# Altium schematic sheet Radar_Sheet2.SchDoc
size 420 x 297 mm; SheetNumber: 5; SheetTotal: 6
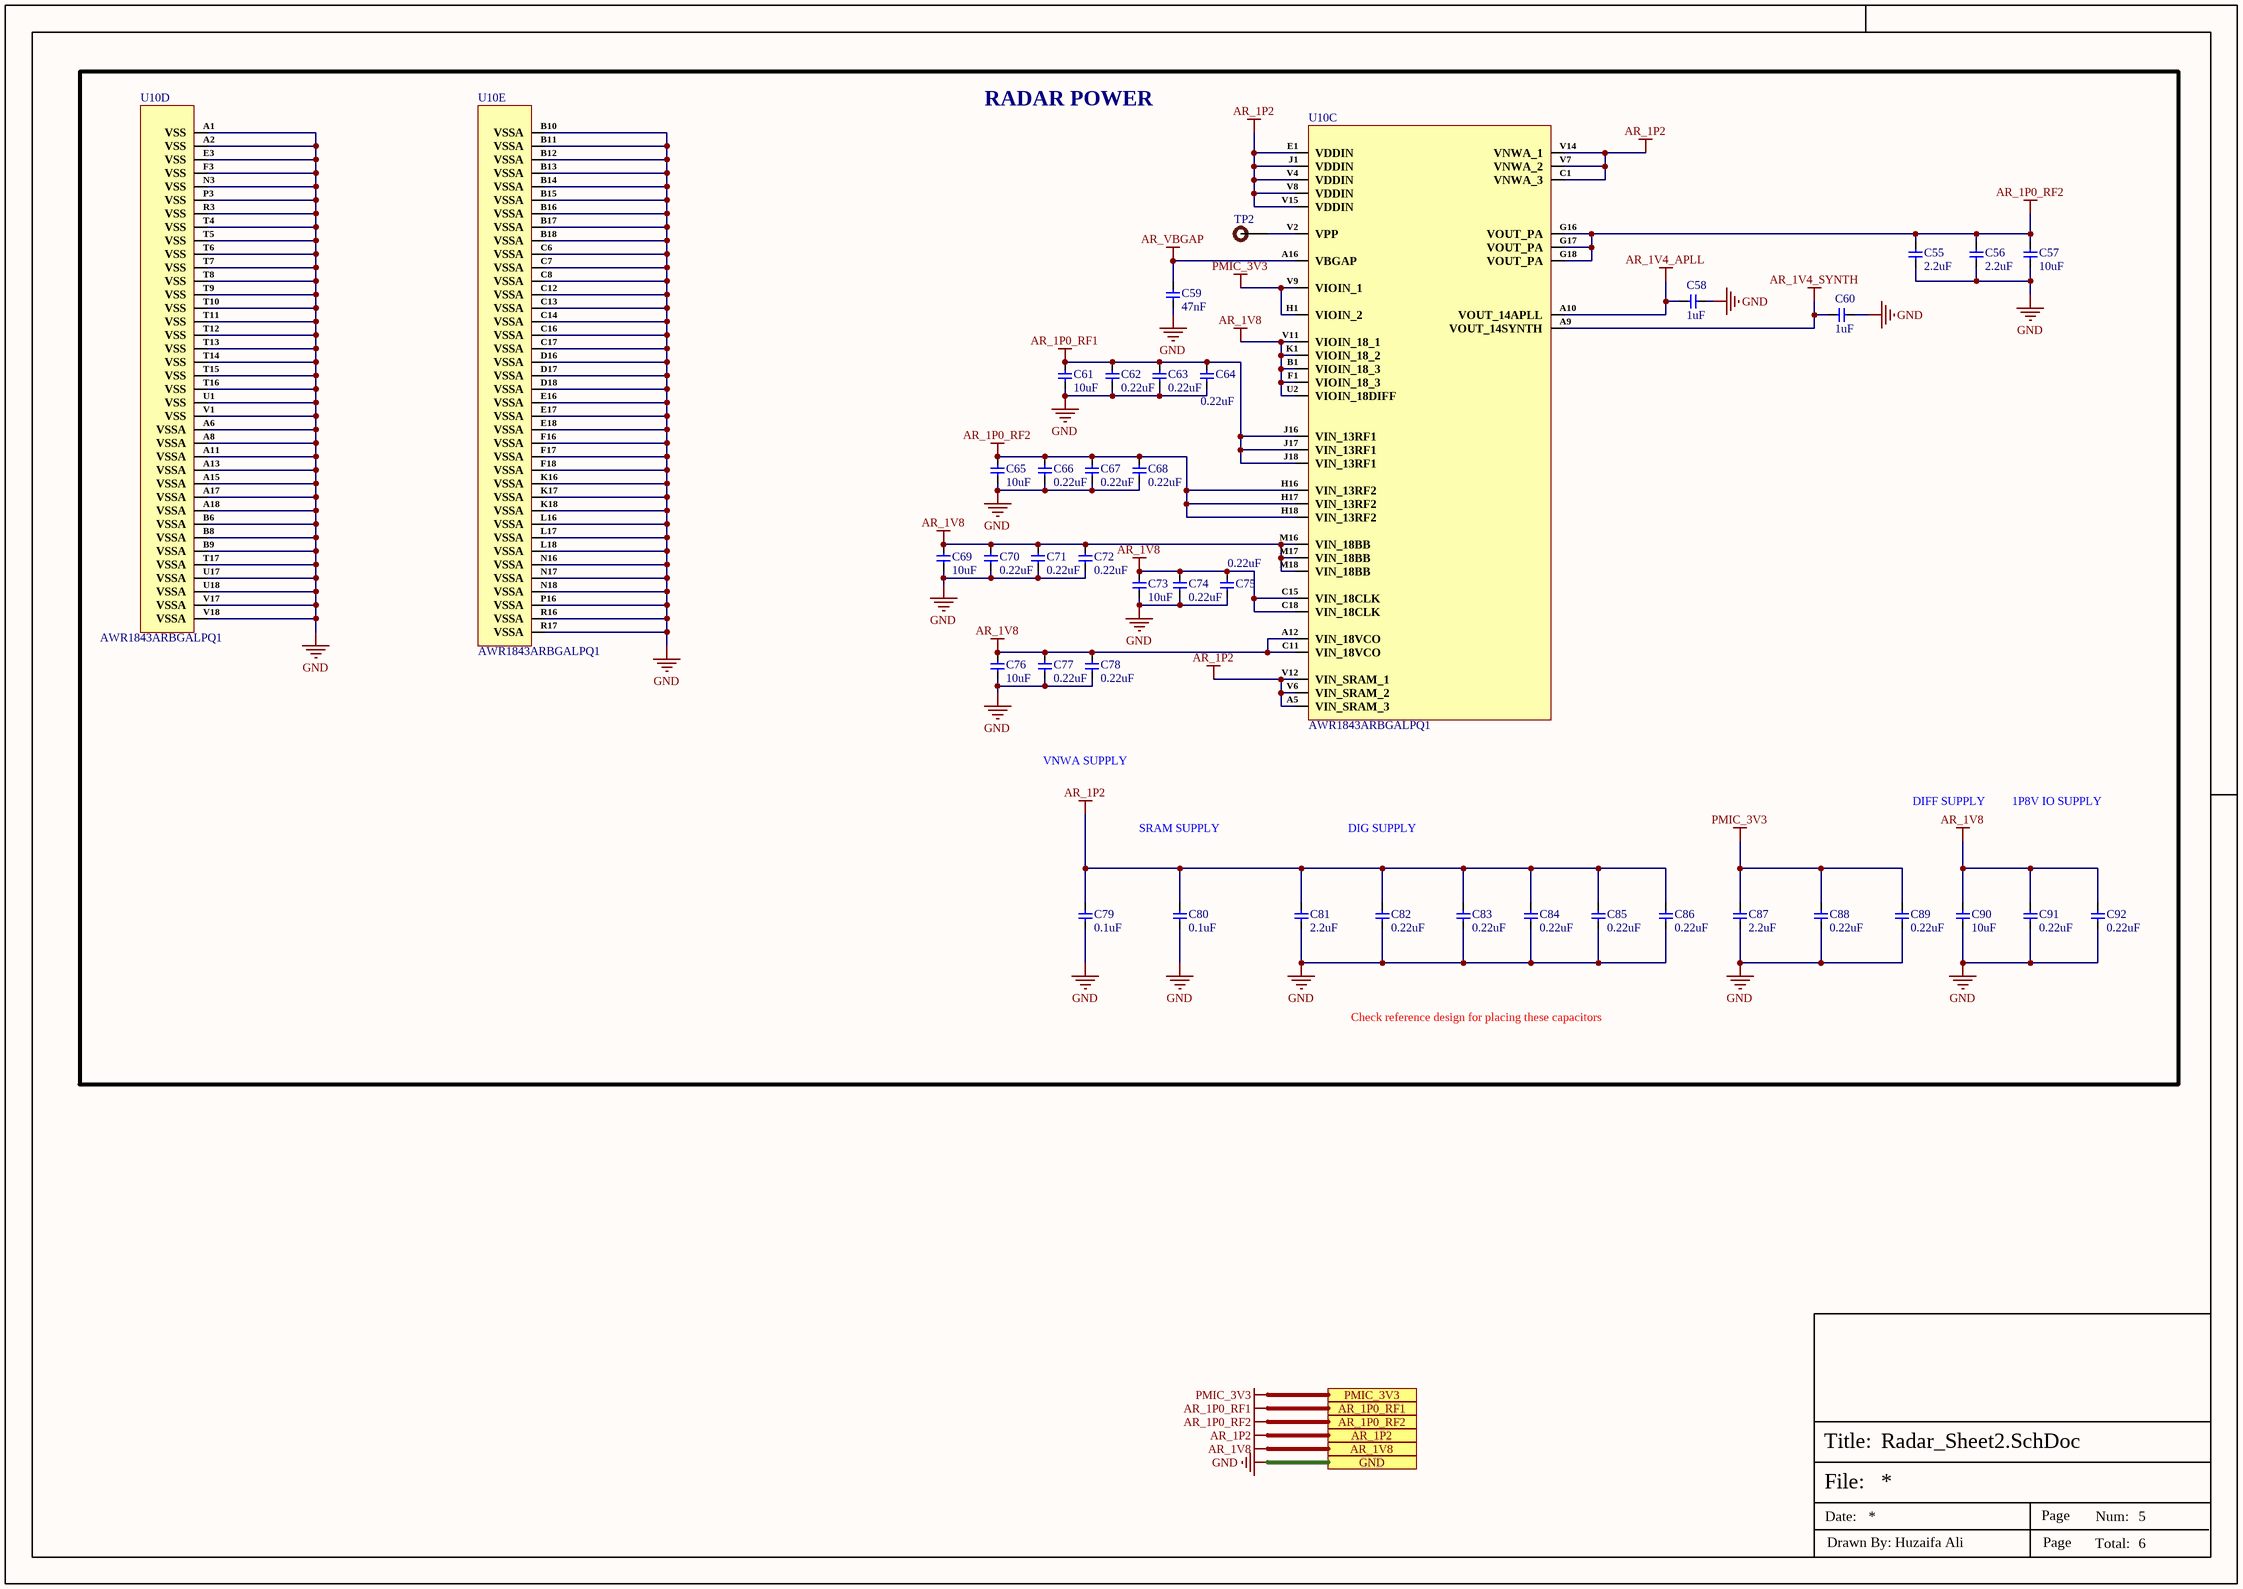
[diagram p0: Radar_Sheet2.SchDoc]

## Parts
C55  2.2uF  [CAP-0603]
C56  2.2uF  [CAP-0603]
C57  10uF  [Cap-0603]
C58  1uF  [Cap-0402]
C59  47nF  [Cap-0402]
C60  1uF  [Cap-0402]
C61  10uF  [Cap-0603]
C62  0.22uF  [Cap-0402]
C63  0.22uF  [Cap-0402]
C64  0.22uF  [Cap-0402]
C65  10uF  [Cap-0603]
C66  0.22uF  [Cap-0402]
C67  0.22uF  [Cap-0402]
C68  0.22uF  [Cap-0402]
C69  10uF  [Cap-0603]
C70  0.22uF  [Cap-0402]
C71  0.22uF  [Cap-0402]
C72  0.22uF  [Cap-0402]
C73  10uF  [Cap-0603]
C74  0.22uF  [Cap-0402]
C75  0.22uF  [Cap-0402]
C76  10uF  [Cap-0603]
C77  0.22uF  [Cap-0402]
C78  0.22uF  [Cap-0402]
C79  0.1uF  [Cap-0402]
C80  0.1uF  [Cap-0402]
C81  2.2uF  [CAP-0603]
C82  0.22uF  [Cap-0402]
C83  0.22uF  [Cap-0402]
C84  0.22uF  [Cap-0402]
C85  0.22uF  [Cap-0402]
C86  0.22uF  [Cap-0402]
C87  2.2uF  [CAP-0603]
C88  0.22uF  [Cap-0402]
C89  0.22uF  [Cap-0402]
C90  10uF  [Cap-0603]
C91  0.22uF  [Cap-0402]
C92  0.22uF  [Cap-0402]
TP2  TEST POINT  [Test-point]  (value not drawn)  (no BOM)
U10  AWR1843ARBGALPQ1  [180-FCBGA (15x15)]  (parts C,D,E of 5)

## Ports
AR_1P0_RF1, AR_1P0_RF2, AR_1P2, AR_1V8, GND, PMIC_3V3

## Nets
AR_1P0_RF1: C61.2 C62.2 C63.2 C64.2 U10.J16(VIN_13RF1) U10.J17(VIN_13RF1) U10.J18(VIN_13RF1) ; port AR_1P0_RF1
AR_1P0_RF2: C55.2 C56.2 C57.2 C65.2 C66.2 C67.2 C68.2 U10.G16(VOUT_PA) U10.G17(VOUT_PA) U10.G18(VOUT_PA) U10.H16(VIN_13RF2) U10.H17(VIN_13RF2) U10.H18(VIN_13RF2) ; port AR_1P0_RF2
AR_1P2: C79.2 C80.2 C81.2 C82.2 C83.2 C84.2 C85.2 C86.2 U10.A5(VIN_SRAM_3) U10.C1(VNWA_3) U10.E1(VDDIN) U10.J1(VDDIN) U10.V4(VDDIN) U10.V6(VIN_SRAM_2) U10.V7(VNWA_2) U10.V8(VDDIN) U10.V12(VIN_SRAM_1) U10.V14(VNWA_1) U10.V15(VDDIN) ; port AR_1P2
AR_1V4_APLL: C58.2 U10.A10(VOUT_14APLL)
AR_1V4_SYNTH: C60.2 U10.A9(VOUT_14SYNTH)
AR_1V8: C69.2 C70.2 C71.2 C72.2 C73.2 C74.2 C75.2 C76.2 C77.2 C78.2 C90.2 C91.2 C92.2 U10.A12(VIN_18VCO) U10.B1(VIOIN_18_3) U10.C11(VIN_18VCO) U10.C15(VIN_18CLK) U10.C18(VIN_18CLK) U10.F1(VIOIN_18_3) U10.K1(VIOIN_18_2) U10.M16(VIN_18BB) U10.M17(VIN_18BB) U10.M18(VIN_18BB) U10.U2(VIOIN_18DIFF) U10.V11(VIOIN_18_1) ; port AR_1V8
AR_VBGAP: C59.2 U10.A16(VBGAP)
GND: C55.1 C56.1 C57.1 C58.1 C59.1 C60.1 C61.1 C62.1 C63.1 C64.1 C65.1 C66.1 C67.1 C68.1 C69.1 C70.1 C71.1 C72.1 C73.1 C74.1 C75.1 C76.1 C77.1 C78.1 C79.1 C80.1 C81.1 C82.1 C83.1 C84.1 C85.1 C86.1 C87.1 C88.1 C89.1 C90.1 C91.1 C92.1 U10.A1(VSS) U10.A2(VSS) U10.A6(VSSA) U10.A8(VSSA) U10.A11(VSSA) U10.A13(VSSA) U10.A15(VSSA) U10.A17(VSSA) U10.A18(VSSA) U10.B6(VSSA) U10.B8(VSSA) U10.B9(VSSA) U10.B10(VSSA) U10.B11(VSSA) U10.B12(VSSA) U10.B13(VSSA) U10.B14(VSSA) U10.B15(VSSA) U10.B16(VSSA) U10.B17(VSSA) U10.B18(VSSA) U10.C6(VSSA) U10.C7(VSSA) U10.C8(VSSA) U10.C12(VSSA) U10.C13(VSSA) U10.C14(VSSA) U10.C16(VSSA) U10.C17(VSSA) U10.D16(VSSA) U10.D17(VSSA) U10.D18(VSSA) U10.E3(VSS) U10.E16(VSSA) U10.E17(VSSA) U10.E18(VSSA) U10.F3(VSS) U10.F16(VSSA) U10.F17(VSSA) U10.F18(VSSA) U10.K16(VSSA) U10.K17(VSSA) U10.K18(VSSA) U10.L16(VSSA) U10.L17(VSSA) U10.L18(VSSA) U10.N3(VSS) U10.N16(VSSA) U10.N17(VSSA) U10.N18(VSSA) U10.P3(VSS) U10.P16(VSSA) U10.R3(VSS) U10.R16(VSSA) U10.R17(VSSA) U10.T4(VSS) U10.T5(VSS) U10.T6(VSS) U10.T7(VSS) U10.T8(VSS) U10.T9(VSS) U10.T10(VSS) U10.T11(VSS) U10.T12(VSS) U10.T13(VSS) U10.T14(VSS) U10.T15(VSS) U10.T16(VSS) U10.T17(VSSA) U10.U1(VSS) U10.U17(VSSA) U10.U18(VSSA) U10.V1(VSS) U10.V17(VSSA) U10.V18(VSSA) ; port GND
PMIC_3V3: C87.2 C88.2 C89.2 U10.H1(VIOIN_2) U10.V9(VIOIN_1) ; port PMIC_3V3
NetTP2_1: TP2.1 U10.V2(VPP)

## Notes on the sheet
- RADAR POWER
- VNWA SUPPLY
- DIFF SUPPLY
- 1P8V IO SUPPLY
- SRAM SUPPLY
- DIG SUPPLY
- Check reference design for placing these capacitors
- File:
- Title:
- Date:
- Page
- Num:
- Total:
- Drawn By: Huzaifa Ali

## Library data of the parts
C55 C56 C81 C87 = CC0603KRX5R8BB225: CAP CER 2.2UF 25V X5R 0603; Manufacturer: Yageo; Tolerance: 10%; Item Type: Capacitor; Supplier 1: Digi-Key; Manufacturer Part Number: CC0603KRX5R8BB225; Stock 1: 687936; Pricing 1: 1=0.4, 10=0.276, 50=0.1932, 100=0.1656, 500=0.1242, 1000=0.10488 (USD); Mount: Surface Mount; Case/Package: 0603; Case Code (Metric): 1608; Case Code (Imperial): 0603; Weight: 7.1E-05oz; Min Operating Temperature: -55°C; Max Operating Temperature: 85°C; Packaging: Tape and Reel; Capacitance: 2.2uF; Dielectric: X5R; Voltage Rating: 25V; Termination: SMD/SMT; Resistor Type: Ceramic; Voltage Rating (DC): 25V; Package Quantity: 4000; Length: 1.6mm; Width: 0.031inch; Thickness: 0.037inch; Depth: 0.8mm; Radiation Hardening: No; Lead Free: Lead Free; Halogen Free: Halogen Free; RoHS Compliant: Yes; ComponentLink1URL: https://www.verical.com/server-webapp/html/getDatasheet?partID=782757&src-supplier=Verical; ComponentLink1Description: https://www.verical.com/server-webapp/html/getDatasheet?partID=782757&src-supplier=Verical; Supplier Part Number 1: 311-1786-1-ND; LCSC Part Number: C309478
C57 C61 C65 C69 C73 C76 C90 = CC0603KRX5R7BB106: CAP CER 10UF 16V X5R 0603; Manufacturer: Yageo; Tolerance: 10%; Item Type: Capacitor; Supplier 1: Digi-Key; Manufacturer Part Number: CC0603KRX5R7BB106; RoHS: Yes; Category: Ceramic Capacitors; Stock 1: 240725; Pricing 1: 1=0.68000, 10=0.48000, 50=0.36300, 100=0.31610, 500=0.23416, 1000=0.19903 (USD); Mount: Surface Mount; Case/Package: 0603; Case Code (Imperial): 0603; Case Code (Metric): 1608; Min Operating Temperature: -55°C; Max Operating Temperature: 85°C; Packaging: Cut Tape; Capacitance: 10uF; Voltage Rating: 16V; RoHS Compliant: Yes; ComponentLink1URL: http://www.yageo.com/documents/recent/UPY-GPHC_X5R_4V-to-50V_25.pdf?src-supplier=Digi-Key; ComponentLink1Description: http://www.yageo.com/documents/recent/UPY-GPHC_X5R_4V-to-50V_25.pdf?src-supplier=Digi-Key; Supplier Part Number 1: 311-3486-1-ND; LCSC Part Number: C2936601
C58 C60 = CC0402KRX5R7BB105: CAP CER 1UF 16V X5R 0402; Manufacturer: Yageo; Tolerance: 10%; Item Type: Capacitor; Supplier 1: Digi-Key; Manufacturer Part Number: CC0402KRX5R7BB105; Stock 1: 1405667; Pricing 1: 1=0.36, 10=0.252, 100=0.1512, 500=0.1134, 1000=0.09576, 2500=0.09072, 5000=0.08568 (USD); Mount: Surface Mount; Case/Package: 0402; Weight: 2.3E-05oz; Case Code (Imperial): 0402; Case Code (Metric): 1005; Min Operating Temperature: -55°C; Max Operating Temperature: 85°C; Capacitance: 1uF; Dielectric: X5R; Packaging: Tape and Reel; Voltage Rating (DC): 16V; Voltage Rating: 16V; Termination: SMD/SMT; Composition: Ceramic; Length: 1mm; Height: 0.5mm; Width: 0.02inch; Thickness: 0.022inch; Depth: 0.5mm; Radiation Hardening: No; Lead Free: Lead Free; Halogen Free: Halogen Free; ComponentLink1URL: http://www.yageo.com/documents/recent/UPY-GPHC_X5R_4V-to-50V_12.pdf?src-supplier=Avnet+Europe; ComponentLink1Description: http://www.yageo.com/documents/recent/UPY-GPHC_X5R_4V-to-50V_12.pdf?src-supplier=Avnet+Europe; Supplier Part Number 1: 311-1691-6-ND; LCSC Part Number: C325464
C59 = CC0402KRX7R9BB473: CAP CER 0.047UF 50V X7R 0402; Manufacturer: Yageo; Material: 4241ConductorMaterial; Tolerance: 10%; Temperature Coefficient: 30ppm/°C; Dielectric: 1511DielectricType; Item Type: Capacitor; Supplier: Future Electronics; Supplier Part Number: 2095687; Manufacturer Part Number: CC0402KRX7R9BB473; RoHS: Yes; Category: Ceramic Capacitors; Stock: 1130000; Pricing: 10000=0.0044, 40000=0.0042, 100000=0.004, 150000=0.0041, 250000=0.0039, 400000=0.0037, 500000=0.0038 (USD); Mounting Technology: Surface Mount; Case/Package: 0402; Case Code (Imperial): 0402; Case Code (Metric): 1005; Min Operating Temperature: -55°C; Max Operating Temperature: 125°C; Packaging: Tape and Reel; Value: 47nF; Voltage Rating: 50V; Series: CC; Voltage Rating (DC): 50V; Length: 0.039inch; Width: 0.02inch; Height: 550um; Thickness: 0.022inch; RoHS Compliant: Yes; Halogen Free: 5694HalogenFree; Lead Free: 5697LeadFree; ComponentLink1URL: https://datasheet.octopart.com/CC0402KRX7R9BB473-Yageo-datasheet-166511530.pdf?src-supplier=Future+Electronics; ComponentLink1Description: https://datasheet.octopart.com/CC0402KRX7R9BB473-Yageo-datasheet-166511530.pdf?src-supplier=Future+Electronics; ComponentLink2URL: http://www.yageo.com/documents/recent/UPY-GPHC_X7R_6.3V-to-50V_18.pdf?src-supplier=Digikey; ComponentLink2Description: http://www.yageo.com/documents/recent/UPY-GPHC_X7R_6.3V-to-50V_18.pdf?src-supplier=Digikey; ComponentLink3URL: https://datasheet.octopart.com/CC0402KRX7R9BB473-Yageo-datasheet-140260305.pdf?src-supplier=Newark; ComponentLink3Description: https://datasheet.octopart.com/CC0402KRX7R9BB473-Yageo-datasheet-140260305.pdf?src-supplier=Newark; LCSC Part Number: C272875
C62-C64 C66-C68 C70-C72 C74 C75 C77 C78 C82-C86 C88 C89 C91 C92 = CC0402KRX5R8BB224: CAP CER 0.22UF 25V X5R 0402; Manufacturer: Yageo; Capacitance: 220nF; Tolerance: 10%; Supplier 1: Mouser; Manufacturer Part Number: CC0402KRX5R8BB224; RoHS: Yes; Category: Ceramic Capacitors; Stock 1: 61266; Pricing 1: 1=0.10000, 10=0.03300, 50=0.03300, 100=0.02700, 1000=0.01500, 10000=0.01300 (USD); Mount: Surface Mount; Case/Package: 0402; Min Operating Temperature: -55°C; Max Operating Temperature: 85°C; Packaging: Tape and Reel; Voltage Rating: 25V; Voltage Rating (DC): 25V; Dielectric: X5R; Length: 0.039inch; Width: 0.02inch; Thickness: 0.022inch; Lead Free: Lead Free; Halogen Free: Halogen Free; RoHS Compliant: Yes; ComponentLink1URL: http://www.yageo.com/documents/recent/UPY-GPHC_X5R_4V-to-50V_25.pdf?src-supplier=Digi-Key; ComponentLink1Description: http://www.yageo.com/documents/recent/UPY-GPHC_X5R_4V-to-50V_25.pdf?src-supplier=Digi-Key; ComponentLink2URL: https://www.yageo.com/upload/media/product/productsearch/datasheet/mlcc/UPY-GPHC_X5R_4V-to-50V_26.pdf?src-supplier=Digi-Key; ComponentLink2Description: https://www.yageo.com/upload/media/product/productsearch/datasheet/mlcc/UPY-GPHC_X5R_4V-to-50V_26.pdf?src-supplier=Digi-Key; ComponentLink3URL: http://www.yageo.com/documents/recent/UPY-GPHC_X5R_4V-to-50V_23.pdf?src-supplier=Digi-Key; ComponentLink3Description: http://www.yageo.com/documents/recent/UPY-GPHC_X5R_4V-to-50V_23.pdf?src-supplier=Digi-Key; Supplier Part Number 1: 603-CC402KRX5R8BB224; LCSC Part Number: C326836
C79 C80 = CC0402JRX7R7BB104: CAP CER 0.1UF 16V X7R 0402; Manufacturer: Yageo; Material: 4241ConductorMaterial; Value: 100nF; Tolerance: 5%; Item Type: Capacitor; Supplier: Digikey; Supplier Part Number: 311-1676-1-ND; Manufacturer Part Number: CC0402JRX7R7BB104; RoHS: Yes; Category: Ceramic Capacitors; Stock: 1659111; Pricing: 1=0.1, 10=0.046, 50=0.0262, 100=0.0203, 500=0.01528, 1000=0.012, 2500=0.01091, 5000=0.01004 (USD); Mounting Technology: Surface Mount; Case/Package: 0402; Case Code (Metric): 1005; Case Code (Imperial): 0402; Min Operating Temperature: -55°C; Max Operating Temperature: 125°C; Dielectric: X7R; Packaging: Tape and Reel; Package Quantity: 10000; Voltage Rating (DC): 16V; Voltage Rating: 16V; Series: CC; Construction: Flat; Length: 0.039inch; Width: 0.02inch; Height: 0.5mm; Thickness: 0.022inch; Lead Free: Lead Free; Halogen Free: Halogen Free; RoHS Compliant: Yes; ComponentLink1URL: https://datasheet.ciiva.com/13210/upy-gphc-x7r-6-3v-to-50v-8-12304-13210152.pdf?src-supplier=Mouser; ComponentLink1Description: https://datasheet.ciiva.com/13210/upy-gphc-x7r-6-3v-to-50v-8-12304-13210152.pdf?src-supplier=Mouser; LCSC Part Number: C541464
TP2 = TEST POINT: Test Point ON; Item Type: TEST POINT
U10 = AWR1843ARBGALPQ1: RF System on a Chip - SoC Single-chip 76-GHz to 81-GHz automotive radar sensor integrating antenna on package, DSP and MCU 180-FCCSP -40 to 125; Manufacturer: Texas Instruments; Item Type: IC; Supplier: Mouser; Supplier Part Number: 595-AWR1843ARBGALPQ1; Manufacturer Part Number: AWR1843ARBGALPQ1; RoHS: No; Category: Integrated Circuits (ICs); Stock: 118; Pricing: 1=46.9, 10=43.76, 50=40.61, 100=37.99, 1000=37.99, 10000=37.99 (USD); Case/Package: 107Case; Pins: 180NUMBER; Length: 15mm; Width: 15mm; Height: 965um; Thickness: 965um